# Altium schematic sheet Piezo_Regulator_Head_Power.SchDoc (part 1 of 3)
size A2; SheetNumber: 2; SheetTotal: 2
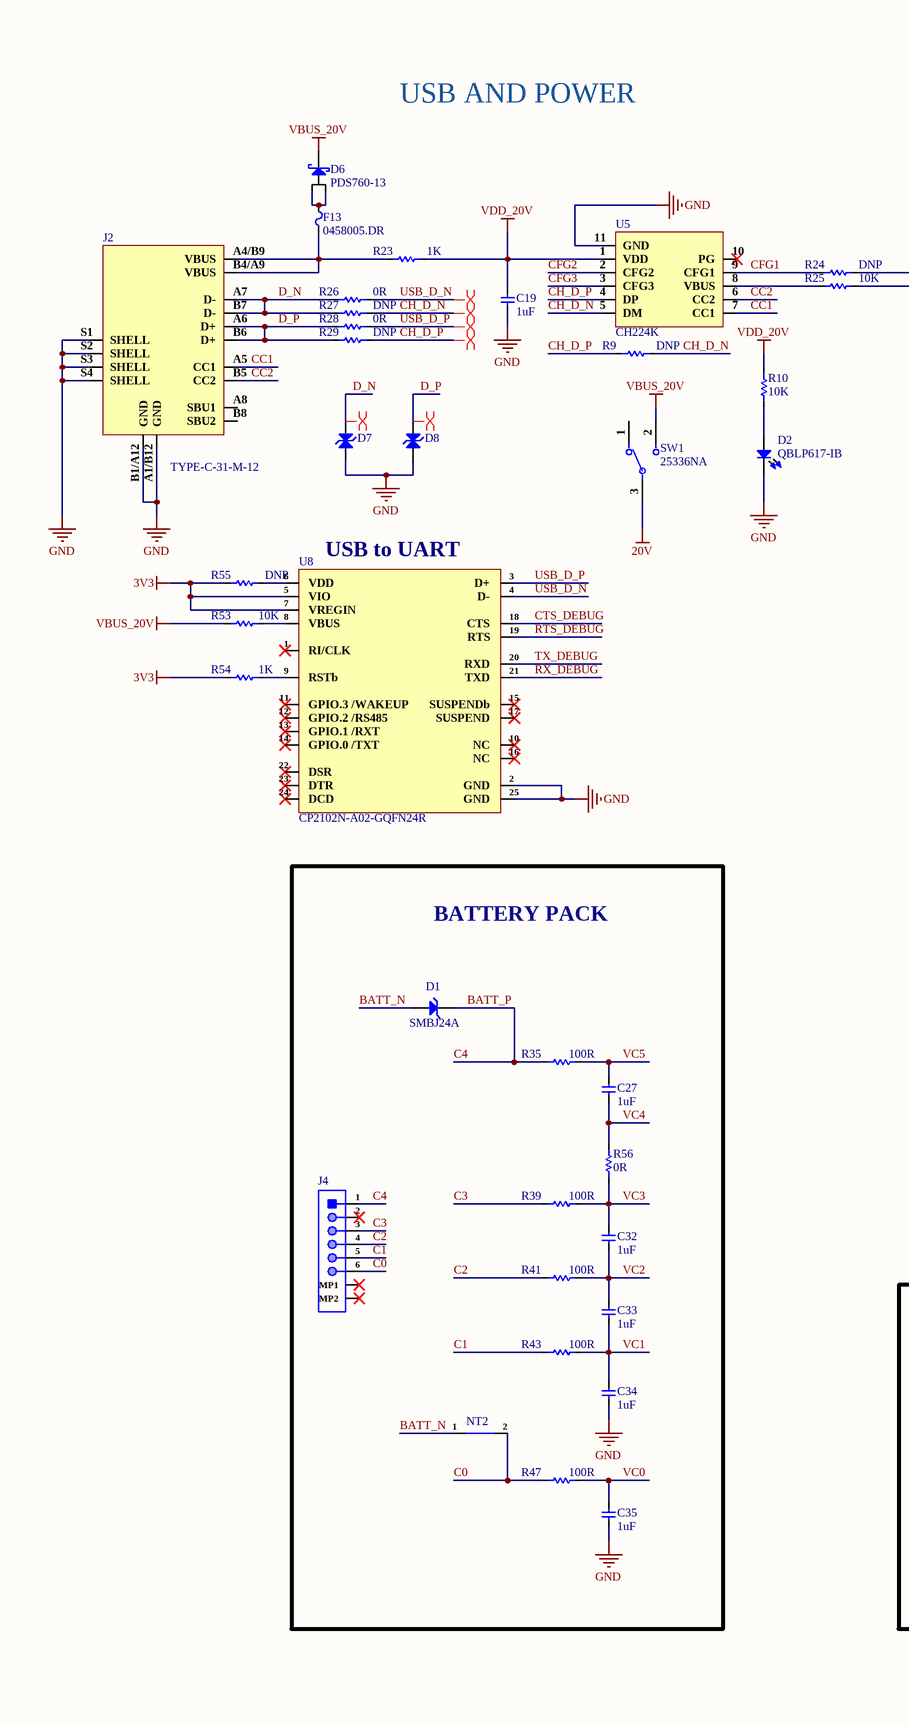
[diagram p0: Piezo_Regulator_Head_Power.SchDoc, left]
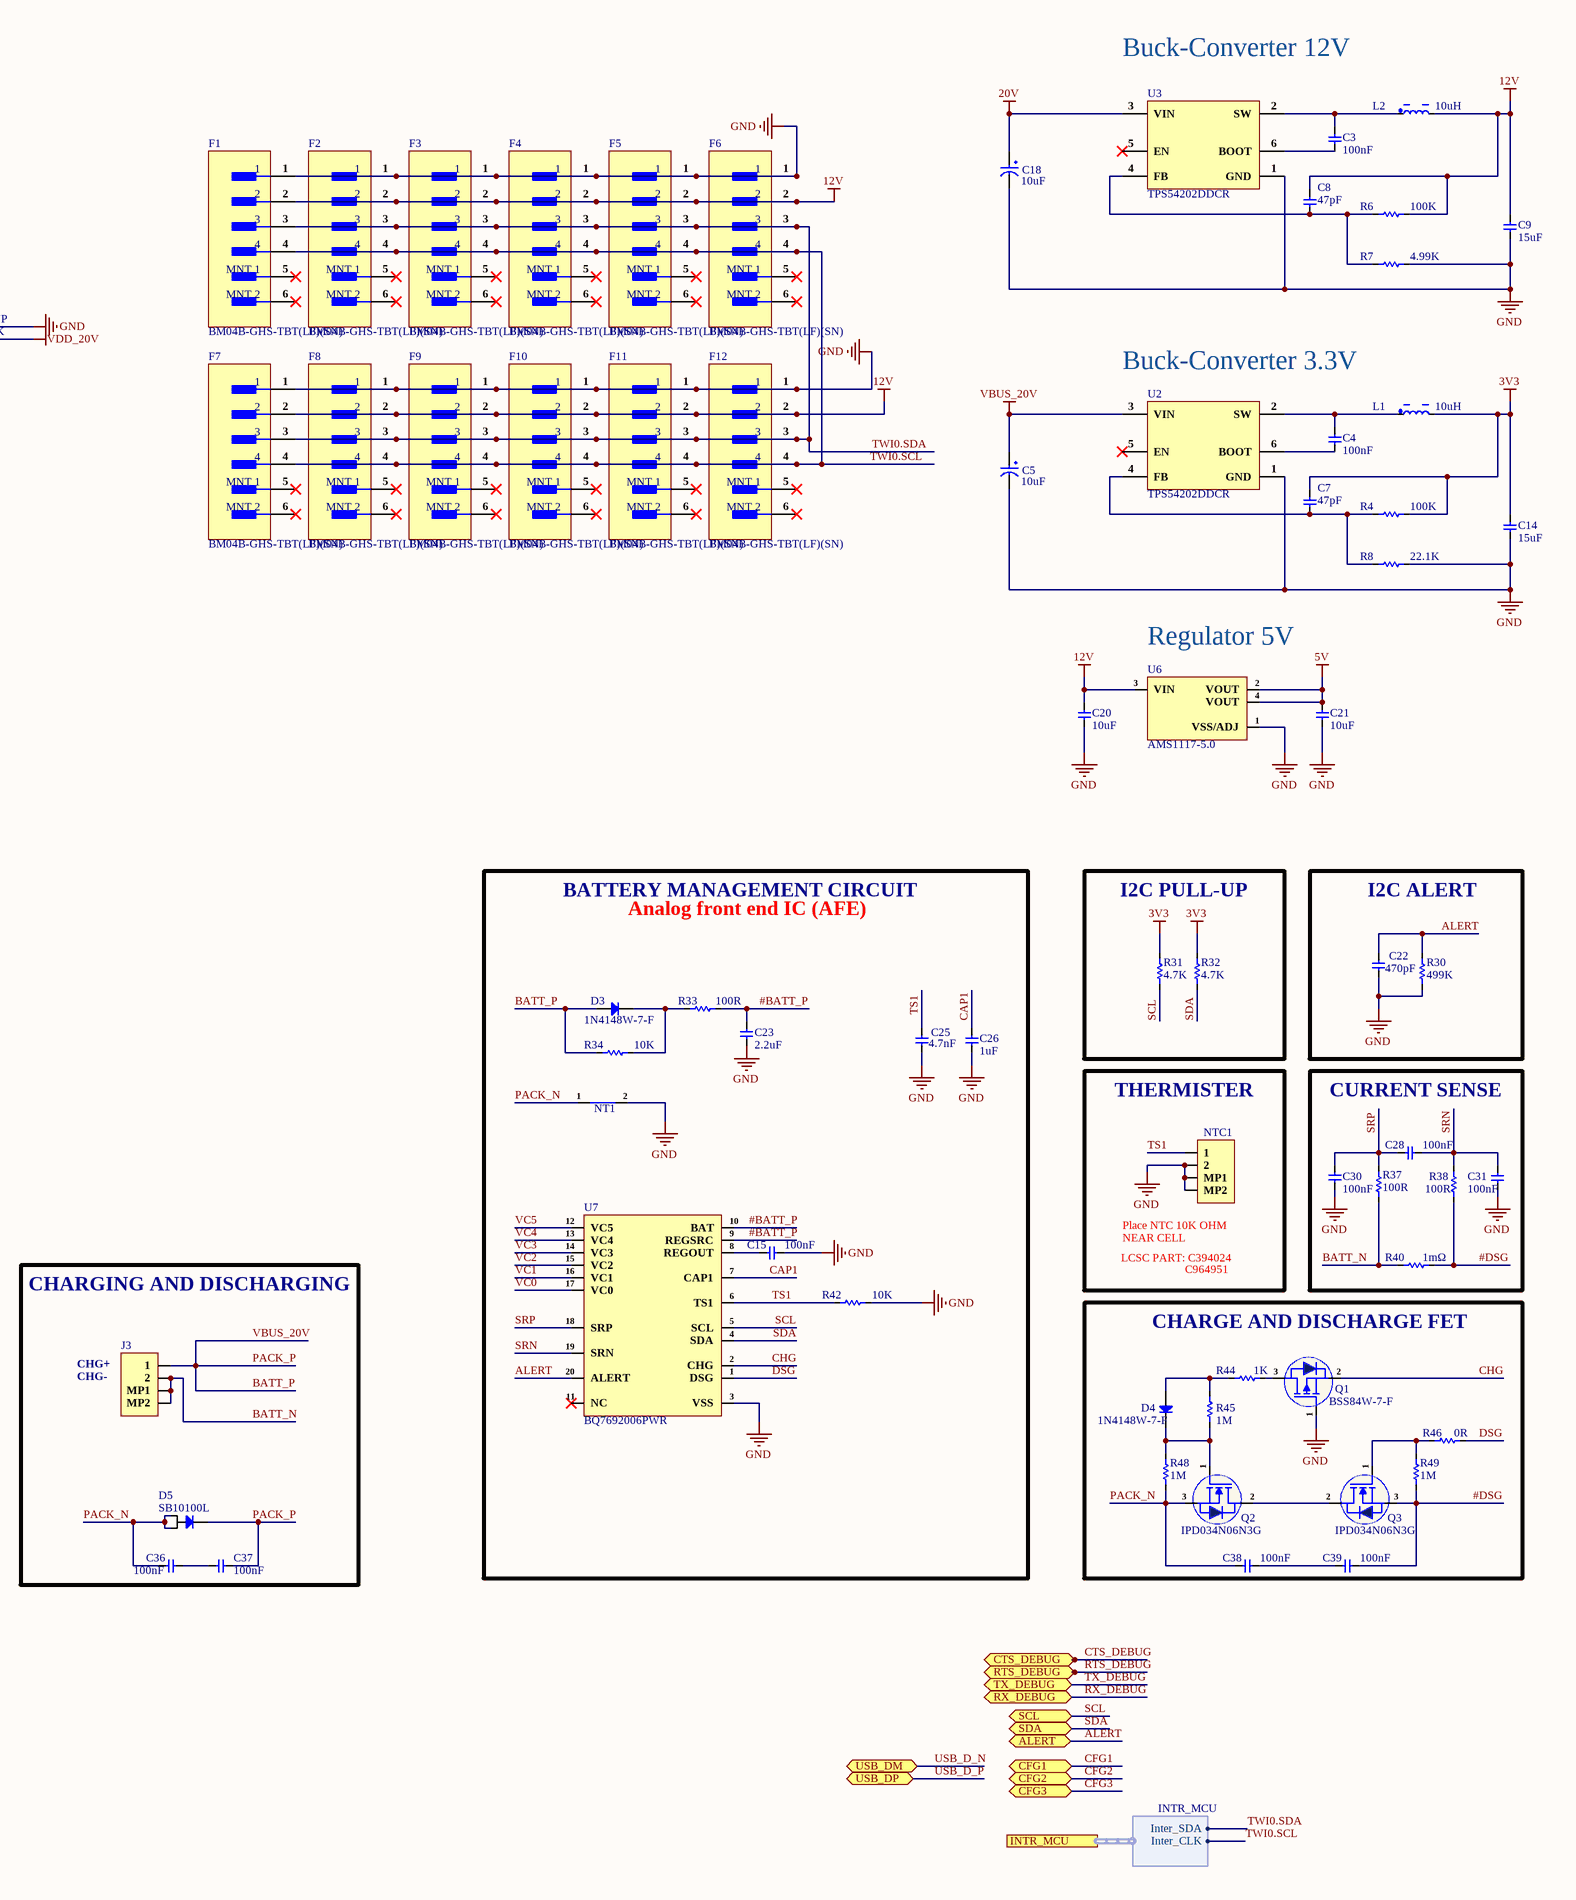
[diagram p1: Piezo_Regulator_Head_Power.SchDoc, right]

## Parts
C3  100nF  [Cap-0603]
C4  100nF  [Cap-0603]
C5  10uF  [Case-C]
C7  47pF  [Cap-0603]
C8  47pF  [Cap-0603]
C9  15uF  [Cap-1206]
C14  15uF  [Cap-1206]
C15  100nF  [Cap-0603]
C18  10uF  [Case-C]
C19  1uF  [Cap-0805]
C20  10uF  [Cap-0603]
C21  10uF  [Cap-0603]
C22  470pF  [Cap-0603]
C23  2.2uF  [Cap-0805]
C25  4.7nF  [Cap-0603]
C26  1uF  [Cap-0603]
C27  1uF  [Cap-0603]
C28  100nF  [Cap-0603]
C30  100nF  [Cap-0603]
C31  100nF  [Cap-0603]
C32  1uF  [Cap-0603]
C33  1uF  [Cap-0603]
C34  1uF  [Cap-0603]
C35  1uF  [Cap-0603]
C36  100nF  [Cap-0603]
C37  100nF  [Cap-0603]
C38  100nF  [Cap-0603]
C39  100nF  [Cap-0603]
D1  SMBJ24A  [SMB_]
D2  QBLP617-IB  [LED-0603]
D3  1N4148W-7-F  [SOD-123]
D4  1N4148W-7-F  [SOD-123]
D5  SB10100L  [SB10100L]
D6  PDS760-13  [Power-DI-5]
D7  ESD5B5.0ST1G  [SOD-523 (Bi-Directional)]  (value not drawn)
D8  ESD5B5.0ST1G  [SOD-523 (Bi-Directional)]  (value not drawn)
F1  BM04B-GHS-TBT(LF)(SN)  [BM04B-GHS-TBT]
F2  BM04B-GHS-TBT(LF)(SN)  [BM04B-GHS-TBT]
F3  BM04B-GHS-TBT(LF)(SN)  [BM04B-GHS-TBT]
F4  BM04B-GHS-TBT(LF)(SN)  [BM04B-GHS-TBT]
F5  BM04B-GHS-TBT(LF)(SN)  [BM04B-GHS-TBT]
F6  BM04B-GHS-TBT(LF)(SN)  [BM04B-GHS-TBT]
F7  BM04B-GHS-TBT(LF)(SN)  [BM04B-GHS-TBT]
F8  BM04B-GHS-TBT(LF)(SN)  [BM04B-GHS-TBT]
F9  BM04B-GHS-TBT(LF)(SN)  [BM04B-GHS-TBT]
F10  BM04B-GHS-TBT(LF)(SN)  [BM04B-GHS-TBT]
F11  BM04B-GHS-TBT(LF)(SN)  [BM04B-GHS-TBT]
F12  BM04B-GHS-TBT(LF)(SN)  [BM04B-GHS-TBT]
F13  0458005.DR  [Fuse 1206 (3216 Metric)]
J2  TYPE-C-31-M-12  [TYPE-C-31-M-12_]
J3  WAFER-PH2.0-2PWB  [WAFER-PH2.0-2PWB]  (value not drawn)
J4  S6B-PH-SM4-TB(LF)(SN)  [S6B-PH-SM4-TB(LF)(SN)]  (value not drawn)
L1  10uH  [78438357100]
L2  10uH  [78438357100]
NT1  Net Tie_SMD  [Net Tie Pad]  (value not drawn)  (net tie, no BOM)
NT2  Net Tie_SMD  [Net Tie Pad]  (value not drawn)  (net tie, no BOM)
NTC1  WAFER-PH2.0-2PWB  [WAFER-PH2.0-2PWB]  (value not drawn)
Q1  BSS84W-7-F  [SOT-323]
Q2  IPD034N06N3G  [TO-252-2L]  (value not drawn)
Q3  IPD034N06N3G  [TO-252-2L]  (value not drawn)
R4  100K  [Res-0603]
R6  100K  [Res-0603]
R7  4.99K  [Res-0603]
R8  22.1K  [Res-0603]
R9  DNP  [Res-0603]
R10  10K  [Res-0603]
R23  1K  [Res-0603]
R24  DNP  [Res-0603]
R25  10K  [Res-0603]
R26  0R  [Res-0603]
R27  DNP  [Res-0603]
R28  0R  [Res-0603]
R29  DNP  [Res-0603]
R30  499K  [Res-0603]
R31  4.7K  [Res-0603]
R32  4.7K  [Res-0603]
R33  100R  [RES-0805]
R34  10K  [Res-0603]
R35  100R  [RES-0805]
R37  100R  [RES-0805]
R38  100R  [RES-0805]
R39  100R  [RES-0805]
R40  1mΩ  [RES 3920]
R41  100R  [RES-0805]
R42  10K  [Res-0603]
R43  100R  [RES-0805]
R44  1K  [RES-0805]
R45  1M  [RES-0805]
R46  0R  [Res-0805]
R47  100R  [RES-0805]
R48  1M  [RES-0805]
R49  1M  [RES-0805]
R53  10K  [Res-0603]
R54  1K  [Res-0603]
R55  DNP  [Res-0603]
R56  0R  [Res-0603]
SW1  25336NA  [25336NA]
U2  TPS54202DDCR  [SOT-23-6 THIN]
U3  TPS54202DDCR  [SOT-23-6 THIN]
U5  CH224K  [ESSOP-10-150mil-1mm]
U6  AMS1117-5.0  [SOT- 223]
U7  BQ7692006PWR  [TSSOP-20]
U8  CP2102N-A02-GQFN24R  [24-WQFN (4x4)]

## Blocks framed on the sheet
BATTERY PACK: C27 C32-C35 D1 J4 NT2 R35 R39 R41 R43 R47 R56
I2C PULL-UP: R31 R32
I2C ALERT: C22 R30
THERMISTER: NTC1
CURRENT SENSE: C28 C30 C31 R37 R38 R40
CHARGING AND DISCHARGING: C36 C37 D5 J3
CHARGE AND DISCHARGE FET: C38 C39 D4 Q1-Q3 R44-R46 R48 R49

## Ports
ALERT (bidir, see Piezo_Regulator_Head_MCU[1D]), CFG1 (bidir, see Piezo_Regulator_Head_MCU[1D]), CFG2 (bidir, see Piezo_Regulator_Head_MCU[1D]), CFG3 (bidir, see Piezo_Regulator_Head_MCU[1D]), CTS_DEBUG (bidir, see Piezo_Regulator_Head_MCU[1C]), INTR_MCU (harness INTR_MCU, see Piezo_Regulator_Head_MCU[1C]), RTS_DEBUG (bidir, see Piezo_Regulator_Head_MCU[1C]), RX_DEBUG (bidir, see Piezo_Regulator_Head_MCU[1C]), SCL (bidir, see Piezo_Regulator_Head_MCU[1D]), SDA (bidir, see Piezo_Regulator_Head_MCU[1D]), TX_DEBUG (bidir, see Piezo_Regulator_Head_MCU[1C]), USB_DM (bidir, see Piezo_Regulator_Head_MCU[1D]), USB_DP (bidir, see Piezo_Regulator_Head_MCU[1D])

## Harnesses
INTR_MCU: Inter_SDA, Inter_CLK

## Nets
3V3: C7.2 C14.2 L1.2 R4.2 R31.2 R32.2 R54.1 R55.1 U8.5(VIO) U8.7(VREGIN)
5V: C21.2 U6.2(VOUT) U6.4(VOUT)
12V: C8.2 C9.2 C20.2 F1.2 F2.2 F3.2 F4.2 F5.2 F6.2 F7.2 F8.2 F9.2 F10.2 F11.2 F12.2 L2.2 R6.2 U6.3(VIN)
20V: C18.1 SW1.3(Common) U3.3(VIN)
BATT_P: C5.1 C37.1 D1.2(K) D3.1(A) D5.3(K) D6.3(K) J3.1 J4.1 R34.2 R35.1 R53.1 SW1.2 U2.3(VIN)  [also labelled C4, PACK_P, VBUS_20V]
GND: C5.2 C9.1 C14.1 C15.1 C18.2 C19.1 C20.1 C21.1 C22.1 C23.1 C25.1 C26.1 C30.2 C31.1 C34.1 C35.1 D2.2 D7.1(A) D8.1(A) F1.1 F2.1 F3.1 F4.1 F5.1 F6.1 F7.1 F8.1 F9.1 F10.1 F11.1 F12.1 J2.A1/B12(GND) J2.B1/A12(GND) J2.S1(SHELL) J2.S2(SHELL) J2.S3(SHELL) J2.S4(SHELL) NT1.2 NTC1.2 NTC1.MP1 NTC1.MP2 Q1.1(G) R7.2 R8.2 R24.2 R30.1 R42.1 U2.1(GND) U3.1(GND) U5.11(GND) U6.1(VSS/ADJ) U7.3(VSS) U8.2(GND) U8.25(GND)
VDD_20V: C19.2 R10.2 R23.2 R25.2 U5.1(VDD)
#BATT_P: C23.2 R33.2 U7.9(REGSRC) U7.10(BAT)
#DSG: C39.1 Q3.3(S) R38.1 R40.2 R49.1
ALERT: C22.2 R30.2 U7.20(ALERT) ; port ALERT
BATT_N: D1.1(A) J3.2 J3.MP1 J3.MP2 NT2.1 R37.1 R40.1
C0: J4.6 NT2.2 R47.1
C1: J4.5 R43.1
C2: J4.4 R41.1
C3: J4.3 R39.1
CAP1: C26.2 U7.7(CAP1)
CC1: J2.A5(CC1) U5.7(CC1)
CC2: J2.B5(CC2) U5.6(CC2)
CFG1: R24.1 U5.9(CFG1) ; port CFG1
CFG2: U5.2(CFG2) ; port CFG2
CFG3: U5.3(CFG3) ; port CFG3
CH_D_N: R9.2 R27.2 U5.5(DM)
CH_D_P: R9.1 R29.2 U5.4(DP)
CHG: Q1.2(S) U7.2(CHG)
CTS_DEBUG: U8.18(CTS) ; port CTS_DEBUG
D_N: D7.2(A) J2.A7(D-) J2.B7(D-) R26.1 R27.1
D_P: D8.2(A) J2.A6(D+) J2.B6(D+) R28.1 R29.1
DSG: R46.1 U7.1(DSG)
PACK_N: C36.2 C38.2 D5.1(A) D5.2(A) NT1.1 Q2.3(S) R48.1
RTS_DEBUG: U8.19(RTS) ; port RTS_DEBUG
RX_DEBUG: U8.21(TXD) ; port RX_DEBUG
SCL: R31.1 U7.5(SCL) ; port SCL
SDA: R32.1 U7.4(SDA) ; port SDA
SRN: C28.1 C31.2 R38.2 U7.19(SRN)
SRP: C28.2 C30.1 R37.2 U7.18(SRP)
TS1: C25.2 NTC1.1 R42.2 U7.6(TS1)
TWI0.SCL: F1.4 F2.4 F3.4 F4.4 F5.4 F6.4 F7.4 F8.4 F9.4 F10.4 F11.4 F12.4 ; port INTR_MCU.Inter_CLK
TWI0.SDA: F1.3 F2.3 F3.3 F4.3 F5.3 F6.3 F7.3 F8.3 F9.3 F10.3 F11.3 F12.3 ; port INTR_MCU.Inter_SDA
TX_DEBUG: U8.20(RXD) ; port TX_DEBUG
USB_D_N: R26.2 U8.4(D-) ; port USB_DM
USB_D_P: R28.2 U8.3(D+) ; port USB_DP
VC0: C35.2 R47.2 U7.17(VC0)
VC1: C33.1 C34.2 R43.2 U7.16(VC1)
VC2: C32.1 C33.2 R41.2 U7.15(VC2)
VC3: C32.2 R39.2 R56.1 U7.14(VC3)
VC4: C27.1 R56.2 U7.13(VC4)
VC5: C27.2 R35.2 U7.12(VC5)
NetC3_1: C3.1 U3.6(BOOT)
NetC3_2: C3.2 L2.1 U3.2(SW)
NetC4_1: C4.1 U2.6(BOOT)
NetC4_2: C4.2 L1.1 U2.2(SW)
NetC7_1: C7.1 R4.1 R8.1 U2.4(FB)
NetC8_1: C8.1 R6.1 R7.1 U3.4(FB)
NetC15_2: C15.2 U7.8(REGOUT)
NetC36_1: C36.1 C37.2
NetC38_1: C38.1 C39.2
NetD2_1: D2.1 R10.1
NetD3_2: D3.2(K) R33.1 R34.1
NetD4_1: D4.1(A) R44.1 R45.2
NetD4_2: D4.2(K) Q2.1(G) R45.1 R48.2
NetD6_1: D6.1(A) D6.2(A) F13.2
NetF13_1: F13.1 J2.A4/B9(VBUS) J2.B4/A9(VBUS) R23.1
NetQ1_3: Q1.3(D) R44.2
NetQ2_2: Q2.2(D) Q3.2(D)
NetQ3_1: Q3.1(G) R46.2 R49.2
NetR25_1: R25.1 U5.8(VBUS)
NetR53_2: R53.2 U8.8(VBUS)
NetR54_2: R54.2 U8.9(RSTb)
NetR55_2: R55.2 U8.6(VDD)

Not connected (* = marked no-connect by the designer): F1 5(MNT_1)* 6(MNT_2)*; F2 5(MNT_1)* 6(MNT_2)*; F3 5(MNT_1)* 6(MNT_2)*; F4 5(MNT_1)* 6(MNT_2)*; F5 5(MNT_1)* 6(MNT_2)*; F6 5(MNT_1)* 6(MNT_2)*; F7 5(MNT_1)* 6(MNT_2)*; F8 5(MNT_1)* 6(MNT_2)*; F9 5(MNT_1)* 6(MNT_2)*; F10 5(MNT_1)* 6(MNT_2)*; F11 5(MNT_1)* 6(MNT_2)*; F12 5(MNT_1)* 6(MNT_2)*; J2 A8(SBU1) B8(SBU2); J4 2* MP1* MP2*; SW1 1; U2 5(EN)*; U3 5(EN)*; U5 10(PG)*; U7 11(NC)*; U8 1(RI/CLK)* 10(NC)* 11(GPIO.3_/WAKEUP)* 12(GPIO.2_/RS485)* 13(GPIO.1_/RXT)* 14(GPIO.0_/TXT)* 15(SUSPENDb)* 16(NC)* 17(SUSPEND)* 22(DSR)* 23(DTR)* 24(DCD)*

## Layout directives
differential pair: D_N, D_P
differential pair; differential pair class D1_Lines; net class D1: USB_D_N
differential pair; net class D1; differential pair class D1_Lines: CH_D_N, CH_D_P, USB_D_P

## Notes on the sheet
- Buck-Converter 12V
- USB AND POWER
- Buck-Converter 3.3V
- (near U8) USB to UART
- Regulator 5V
- BATTERY MANAGEMENT CIRCUIT
- Analog front end IC (AFE)
- (near NTC1) Place NTC 10K OHM NEAR CELL
- LCSC PART: C394024
- C964951
- CHG+
- CHG-
- IPD034N06N3G